# Altium schematic sheet Power.SchDoc
size A4; SheetNumber: 4; SheetTotal: 5
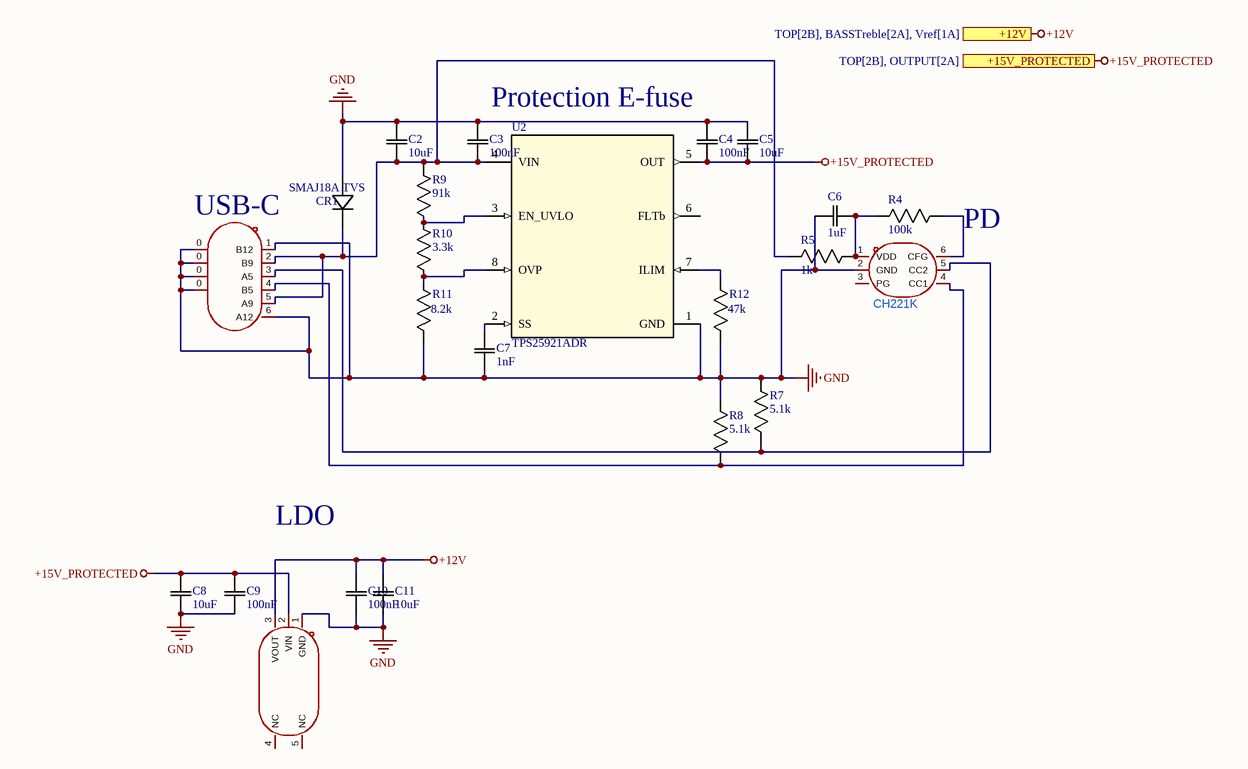
[diagram p0: Power.SchDoc]

## Parts
C2  10uF  [0805 CAP - C0G]
C3  100nF  [0603 Cap - C0G]
C4  100nF  [0603 Cap - C0G]
C5  10uF  [0805 CAP - C0G]
C6  1uF  [0603 Cap - C0G]
C7  1nF  [0603 Cap - C0G]
C8  10uF  [0805 CAP - C0G]
C9  100nF  [0603 Cap - C0G]
C10  100nF  [0603 Cap - C0G]
C11  10uF  [0805 CAP - C0G]
CR1  SMAJ18A TVS  [TVS diode]
Q1  CH221K  [CH221K]
R4  100k  [0603 RES]
R5  1k  [0603 RES]
R7  5.1k  [0603 RES]
R8  5.1k  [0603 RES]
R9  91k  [0603 RES]
R10  3.3k  [0603 RES]
R11  8.2k  [0603 RES]
R12  47k  [0603 RES]
U2  TPS25921ADR  [TPS25921ADR e-fuse]
U3  ht75c0-2  [LDO]  (value not drawn)
USB2  type-c-31-m-17  [USB-C-SMD_10P-P1.00-L6.8-W8.9]  (value not drawn)

## Ports
+12V (out, see TOP[2B], BASSTreble[2A], Vref[1A]), +15V_PROTECTED (out, see TOP[2B], OUTPUT[2A])

## Nets
+12V: C10.2 C11.2 U3.3(VOUT) ; port +12V
+15V_PROTECTED: C4.1 C5.1 C8.2 C9.2 U2.5(OUT) U3.2(VIN) ; port +15V_PROTECTED
GND: C2.2 C3.2 C4.2 C5.2 C6.1 C7.1 C8.1 C9.1 C10.1 C11.1 CR1.2 Q1.2(GND) R7.1 R8.1 R11.2 R12.2 U2.1(GND) U3.1(GND) USB2.0 USB2.1(B12) USB2.6(A12)
NetC2_1: C2.1 C3.1 CR1.1 R5.1 R9.1 U2.4(VIN) USB2.2(B9) USB2.5(A9)
NetC6_2: C6.2 Q1.1(VDD) R4.2 R5.2
NetC7_2: C7.2 U2.2(SS)
NetQ1_4: Q1.4(CC1) R8.2 USB2.4(B5)
NetQ1_5: Q1.5(CC2) R7.2 USB2.3(A5)
NetQ1_6: Q1.6(CFG) R4.1
NetR9_2: R9.2 R10.1 U2.3(EN_UVLO)
NetR10_2: R10.2 R11.1 U2.8(OVP)
NetR12_1: R12.1 U2.7(ILIM)

Not connected (* = marked no-connect by the designer): Q1 3(PG); U2 6(FLTb); U3 4(NC) 5(NC)

## Notes on the sheet
- Protection E-fuse
- (near USB2) USB-C
- PD
- LDO

## Library data of the parts
C2-C11 = CAP_CERAMIC: Manufacturer_Name: Kemet; Manufacturer_Part_Number: C0603C104K5RACTU; Copyright: Copyright (C) 2026 Ultra Librarian. All rights reserved.
CR1 = SMAJ18A TVS: Description; Manufacturer_Name: Bourns Electronics; Copyright: Copyright (C) 2026 Ultra Librarian. All rights reserved.; Manufacturer_Part_Number: SMAJ18A
Q1 = CH221K: 100W PD3.2 / 100K请求15V; Manufacturer: WCH(南京沁恒); AddInBom: yes; ModelId: 838e09e61e8e47a1ac5306b7bfd21d61; ModelName: SOT-23-6_L2.9-W1.6-P0.95-LS2.8-BL-2; ModelTransform: 114.173,110.236,0,0,0,0,0,0,0; Type: Power Receiver Controller; Protocol: PD 3.0; Output Voltage: 5V；20V；15V；12V；9V; Symbol: CH221K; LCSC Part Name: USBPD多快充协议受电芯片; SupplierPart: C5125736; ManufacturerPart: CH221K; Supplier Footprint: SOT-23-6; JLCPCB Part Class: Extended Part; Datasheet: https://item.szlcsc.com/datasheet/CH221K/5724821.html; Supplier: LCSC; ConvertToPcb: yes; FootprintName: SOT-23-6_L2.9-W1.6-P0.95-LS2.8-BL-2; Number of Channels: -; Output Power: 100W; Voltage - Supply: -; Operating Temperature: -40℃~+105℃
R4 R5 R7-R12 = Resistor: Manufacturer_Name: Vishay; Manufacturer_Part_Number: CRCW060310K0FKEA; Copyright: Copyright (C) 2025 Ultra Librarian. All rights reserved.
U2 = TPS25921ADR e-fuse: 4.5-V to 18-V, 90mÎ©, 0.4-1.6A eFuse with auto retry fault response 8-SOIC -40 to 85; Manufacturer_Name: Texas Instruments; CompType: IC; TYPE: TYPE; RefDes: RefDes; Copyright: Copyright (C) 2026 Ultra Librarian. All rights reserved.; Manufacturer_Part_Number: TPS25921ADR; PartNumber: TPS25921AD; PackageReference: D0008A; MountType: SMT; RoHS: Y; Manufacturer: Texas Instruments
U3 = ht75c0-2 LDO: Output Configuration:Positive Voltage - Supply:30V Output Voltage:12V Output Voltage:12V Output Current:150mA Power Supply Rejection Ratio (PSRR):- Voltage Dropout:25mV@(1mA) standby current:2.5uA Operating Temperature:-40℃~+85℃ Operating Temperature:-40℃; Manufacturer: HOLTEK(合泰/盛群); AddInBom: yes; ModelId: 3168b22659ce4998ae232d44bb704e0a; ModelName: SOT-23-5_L2.9-W1.6-H1.1-LS2.8-P0.95; ModelTransform: 114.173,109.636,0,180,0,0,0,0,0; Voltage - Supply: 30V; Output Voltage: 12V; Output Current: 150mA; standby current: 2.5uA; Output Type: Fixed; Number of Outputs: 1; Symbol: HT75C0-2; LCSC Part Name: 12V 150mA 30V; SupplierPart: C95005; ManufacturerPart: HT75C0-2; Supplier Footprint: SOT-23-5; JLCPCB Part Class: Extended Part; Supplier: LCSC; ConvertToPcb: yes; FootprintName: SOT-23-5_L3.0-W1.7-P0.95-LS2.8-BR; Output Configuration: Positive; Power Supply Rejection Ratio (PSRR): -; Voltage Dropout: 25mV@(1mA); Operating Temperature: -40℃~+85℃
USB2 = type-c-31-m-17: Connector Type:Type-C Protocol Standard:- Gender:Female Mounting Type:Surface Mount, Right Angle Number of Contacts:6P Number of Ports:1 Current Rating-Power:5A Voltage Rating:20V Connect-Disconnect Life:3,000 Cycles Length:6.8mm Operating Temperature:-30; Manufacturer: 韩国韩荣; AddInBom: yes; ModelId: ab6076bf4dcb42b58b12fcacb7ccdaa0; ModelName: TYPE-C-SMD_6P-L8.9-W6.8-H3.2-P1.00; ModelTransform: 351.9678,267.716,0,180,0,0,-0.001,-47.957,-39.37; Connector Type: Type-C; Gender: Female; Number of Contacts: 6P; Number of Ports: 1; Current Rating-Power: 5A; Voltage Rating: 20V; Symbol: TYPE-C-31-M-17; Supplier: LCSC; Supplier Part: C283540; Manufacturer Part: TYPE-C-31-M-17; JLCPCB Part Class: Extended Part; LCSC Part Name: Type-C 母 卧贴; Supplier Footprint: SMD; Datasheet: https://item.szlcsc.com/datasheet/TYPE-C-31-M-17/269351.html; ConvertToPcb: yes; FootprintName: USB-C-SMD_10P-P1.00-L6.8-W8.9; Protocol Standard: -; Mounting Type: Surface Mount, Right Angle; Connect-Disconnect Life: 3,000 Cycles; Length: 6.8mm; Operating Temperature: -30℃~+80℃